# Altium schematic sheet led_cc_driver_g.SchDoc
size 297 x 209 mm
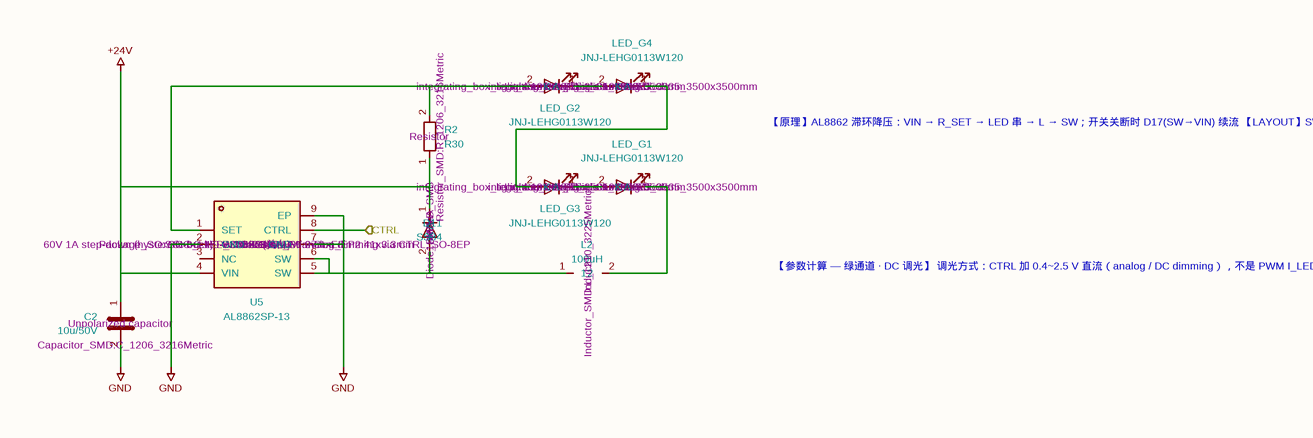
[diagram p0: led_cc_driver_g.SchDoc]

## Parts
C2  Description: Unpolarized capacitor  Footprint: Capacitor_SMD:C_1206_3216Metric  [C_1206_3216Metric]  (hidden comment: 10u/50V)
D11  Description: Diode  Sim.Pins: 1=K 2=A  Footprint: Diode_SMD:D_SMB  [D_SMB]  (hidden comment: SS34)
L2  Description: Inductor  Footprint: Inductor_SMD:L_1210_3225Metric  [L_1210_3225Metric]  (hidden comment: 100uH)
LED_G1  Description: Light emitting diode  Sim.Pins: 1=K 2=A  LCSC Part: C19185875  Footprint: integrating_box_light_source:LED_3535_3500x3500mm  [LED_3535_3500x3500mm]  (hidden comment: JNJ-LEHG0113W120)
LED_G2  Description: Light emitting diode  Sim.Pins: 1=K 2=A  LCSC Part: C19185875  Footprint: integrating_box_light_source:LED_3535_3500x3500mm  [LED_3535_3500x3500mm]  (hidden comment: JNJ-LEHG0113W120)
LED_G3  Description: Light emitting diode  Sim.Pins: 1=K 2=A  LCSC Part: C19185875  Footprint: integrating_box_light_source:LED_3535_3500x3500mm  [LED_3535_3500x3500mm]  (hidden comment: JNJ-LEHG0113W120)
LED_G4  Description: Light emitting diode  Sim.Pins: 1=K 2=A  LCSC Part: C19185875  Footprint: integrating_box_light_source:LED_3535_3500x3500mm  [LED_3535_3500x3500mm]  (hidden comment: JNJ-LEHG0113W120)
R2  Description: Resistor  Footprint: Resistor_SMD:R_1206_3216Metric  [R_1206_3216Metric]  (hidden comment: R30)
U5  Description: 60V 1A step-down (hysteretic buck) LED driver, PWM/analog dimming via CTRL, SO-8EP  LCSC Part: C526360  Manufacturer: DIODES(美台)  Package: SO-8_L4.9-W3.9-P1.27-LS6.0-BL-EP  Footprint: Package_SO:SOIC-8-1EP_3.9x4.9mm_P1.27mm_EP2.41x3.3mm  [SOIC-8-1EP_3.9x4.9mm_P1.27mm_EP2.41x3.3mm]  (hidden comment: AL8862SP-13)

## Ports
CTRL (in)

## Nets
+24V: C2.1 D11.1(K) R2.1 U5.4(VIN)
GND: C2.2 U5.2(GND) U5.7(GND) U5.9(EP)
CTRL: U5.8(CTRL) ; port CTRL
NetD11_2: D11.2(A) L2.1 U5.5(SW) U5.6(SW)
NetL2_2: L2.2 LED_G1.1(K)
NetLED_G1_2: LED_G1.2(A) LED_G3.1(K)
NetLED_G2_1: LED_G2.1(K) LED_G4.2(A)
NetLED_G2_2: LED_G2.2(A) R2.2 U5.1(SET)
NetLED_G3_2: LED_G3.2(A) LED_G4.1(K)

Not connected (* = marked no-connect by the designer): U5 3(NC)

## Notes on the sheet
- 【原理】AL8862 滞环降压：VIN → R_SET → LED 串 → L → SW；开关关断时 D17(SW→VIN) 续流
  【LAYOUT】SW→L/D 走线最短以降低 EMI；EP 大面积铺铜 + 散热过孔；R_SET 与 VIN/SET 用 Kelvin 接法
  【焊接】3535 灯珠回流焊 240±5℃/6s，只建议返修时手工焊（<300℃/3s）
- 【参数计算 — 绿通道 · DC 调光】
  调光方式：CTRL 加 0.4~2.5 V 直流（analog / DC dimming），不是 PWM
  I_LED(100%) = 0.1/0.30 = 333 mA；ΔI = 26 mV/R_SET = 86.6 mA（VSET_HYS = ±13%，固定值）
  V_LED = 4×3.2 V = 12.8 V（Vf 2.8~3.5 V，取典型 3.2）
  t_OFF = 100µ×86.6m/(12.8+0.5+0.13) = 650 ns
  t_ON = 8.66µ/(24−12.8−0.13) = 783 ns → f_SW = 698 kHz（满载 CCM）
  调暗到 10%：纹波仍 ~86.6 mA > 平均 33 mA → 进 DCM，频率下降（与手册“负载范围内校核 on/off 时间”一致）
  P_R_SET = 0.033 W；单颗灯珠约 1.1 W，焊盘铺铜按 3535 规格书
- 1
- 2
- 3
- 4
- 5
- 6
- A
- B
- C
- 通道：绿光 525nm / 4 颗 3535 串联
- IC：AL8862SP-13 (LCSC C526360)
- 灯珠：JNJ-LEHG0113W120 (LCSC C19185875)
- D
- Title: LED 恒流驱动 — 绿光通道
- File: led_cc_driver_g.kicad_sch
- Sheet: /
- integrating_box_light_source
- KiCad E.D.A.  kicad (5.1.4)-1
- Size: A4
- Date: 2026-11-08
- Rev: A
- Id: 1/1

## Library data of the parts
C2 = C: Value: 10u/50V
D11 = D: Sim.Device: D; Value: SS34
L2 = L: Value: 100uH
LED_G1-LED_G4 = LED: Value: JNJ-LEHG0113W120
R2 = R: Value: R30
U5 = AL8862SP-13: MPN: AL8862SP-13; Value: AL8862SP-13